# Altium schematic sheet 01_Power.SchDoc
size A3; SheetNumber: 2; SheetTotal: 6
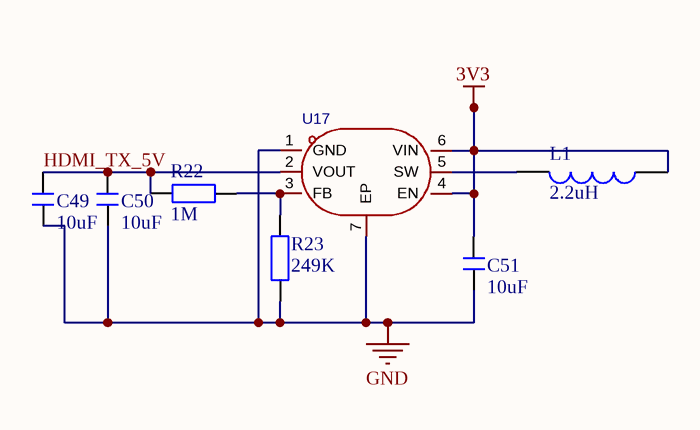
[diagram p0: 01_Power.SchDoc]

## Parts
C49  10uF  [C 0603_L]
C50  10uF  [C 0603_L]
C51  10uF  [C 0603_L]
L1  2.2uH  [L]
R22  1M  [R 0603_L]
R23  249K  [R 0603_L]
U17  tps61099drvr  [WSON-6_L2.0-W2.0-P0.65-TL-EP]  (value not drawn)

## Nets
3V3: C51.2 L1.1 U17.4(EN) U17.6(VIN)
GND: C49.1 C50.1 C51.1 R23.1 U17.1(GND) U17.7(EP)
HDMI_TX_5V: C49.2 C50.2 R22.1 U17.2(VOUT)
NetL1_2: L1.2 U17.5(SW)
NetR22_2: R22.2 R23.2 U17.3(FB)

## Library data of the parts
C49-C51 = C: 贴片电容; BOM名称: 无极性贴片电容; 淘宝ID: 封装库来自淘宝 ID：黄晶宝石; 联系售后: https://shop463601444.taobao.com
L1 = L: 小功率贴片电感; 淘宝ID: 封装库来自淘宝 ID：黄晶宝石; BOM名称: 小功率贴片电感; 联系售后: https://shop463601444.taobao.com
R22 R23 = R: 贴片电阻; 版权归属: 来自淘宝 ID：黄晶宝石; BOM名称: 贴片电阻; 联系售后: https://shop463601444.taobao.com
U17 = tps61099drvr: 功能类型:升压型;工作电压:700mV~5.5V;输出电压:1.8V~5.5V;输出电流:-;输出类型:可调;; Manufacturer: TI(德州仪器); AddInBom: yes; ModelId: 521c6d8f59ad4736925338f4a59f8ef4; ModelName: WSON-6_L2.0-W2.0-H0.8-P0.65; ModelTransform: 79.527,78.74,0,0,0,0,0,0,0; Function: 升压型; Synchronous Rectifier: 是; Number of Outputs: 1; Topology: 升压式; Quiescent Current: 1uA; Switch tube (built-in/external): 内置; Output Type: 可调; Symbol: TPS61099DRVR; LCSC Part Name: 升压型 700mV~5.5V; SupplierPart: C2842395; ManufacturerPart: TPS61099DRVR; Supplier Footprint: WSON-6-EP(2x2); JLCPCB Part Class: Extended Part; Datasheet: https://www.ti.com/cn/lit/gpn/tps61099; Supplier: LCSC; ConvertToPcb: yes; FootprintName: WSON-6_L2.0-W2.0-P0.65-TL-EP; Voltage - Supply: 700mV~5.5V; Output Voltage: 1.8V~5.5V; Output Current: -; Frequency - Switching: -; Operating Temperature: -40℃~+150℃@(TJ); Features: 轻载高效模式；逐波限流；过流保护；负载断开